# Altium schematic sheet MCU.SchDoc
size A; SheetNumber: 1; SheetTotal: 3
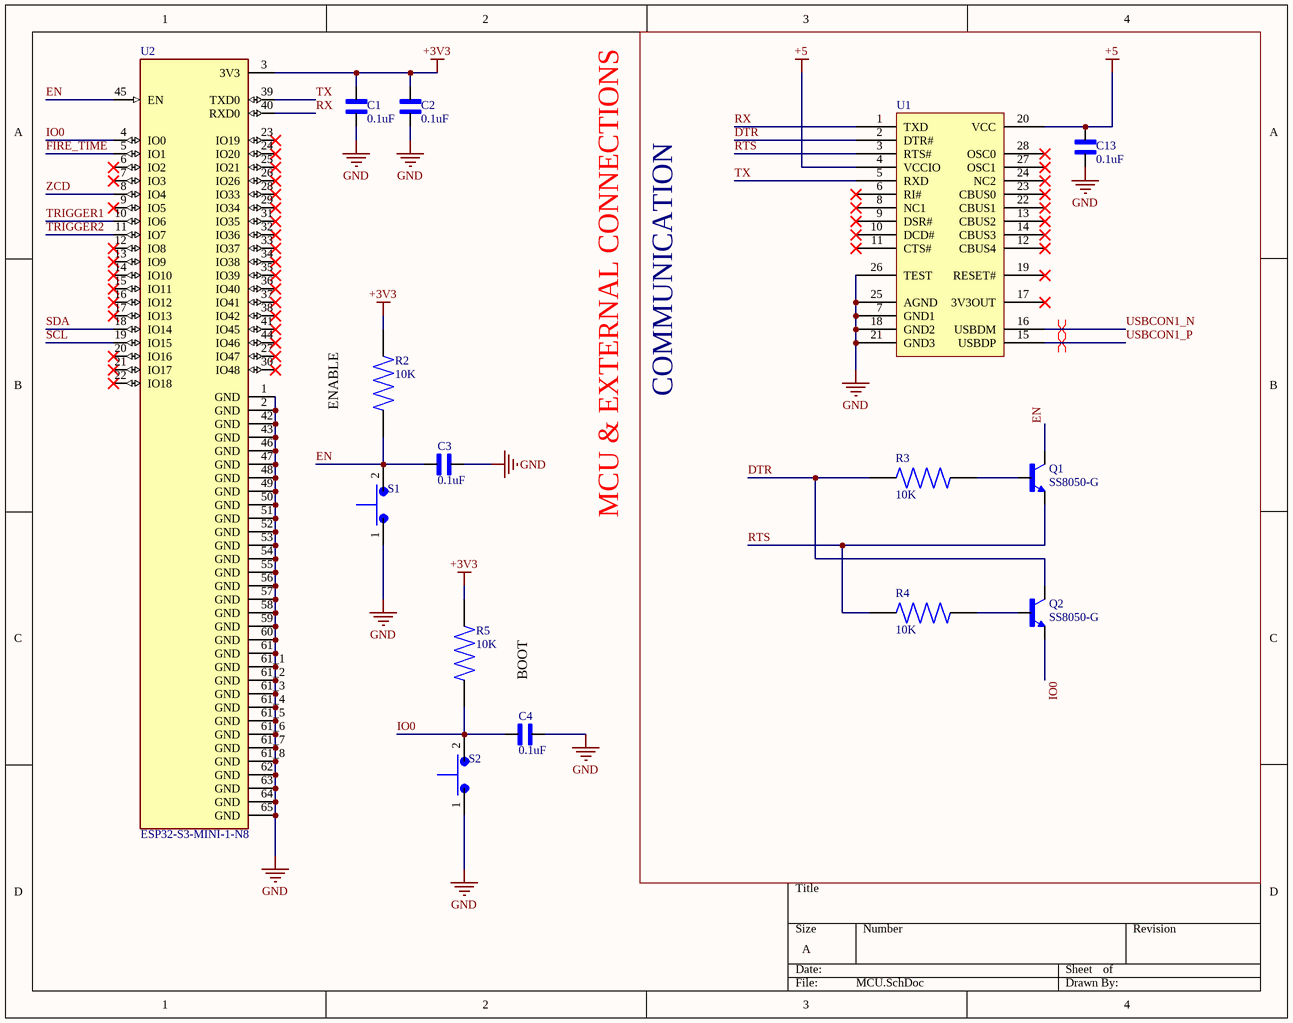
[diagram p0: MCU.SchDoc]

## Parts
C1  0.1uF  [CAPC1005X61N]
C2  0.1uF  [CAPC1005X61N]
C3  0.1uF  [CAPC1005X61N]
C4  0.1uF  [CAPC1005X61N]
C13  0.1uF  [CAPC1005X61N]
Q1  SS8050-G  [TRANS_SS8050-G]
Q2  SS8050-G  [TRANS_SS8050-G]
R2  10K  [RESC1005X35N]
R3  10K  [RESC1005X35N]
R4  10K  [RESC1005X35N]
R5  10K  [RESC1005X35N]
S1  TS10-63-26-BE-250-SMT-TR  [SW_TS10-63-26-BE-250-SMT-TR]  (value not drawn)
S2  TS10-63-26-BE-250-SMT-TR  [SW_TS10-63-26-BE-250-SMT-TR]  (value not drawn)
U1  FT232RL, Universal Asynchronous Receiver & Transmitter 3MBd, 28-Pin, SSOP  [SOP65P780X200-28N]  (value not drawn)
U2  ESP32-S3-MINI-1-N8  [XCVR_ESP32-S3-MINI-1-N8]

## Blocks framed on the sheet
COMMUNICATION: C13 Q1 Q2 R3 R4 U1

## Nets
+3V3: C1.2 C2.2 R2.2 R5.2 U2.3(3V3)
+5: C13.2 U1.4(VCCIO) U1.20(VCC)
GND: C1.1 C2.1 C3.2 C4.2 C13.1 S1.1 S2.1 U1.7(GND1) U1.18(GND2) U1.21(GND3) U1.25(AGND) U1.26(TEST) U2.1(GND) U2.2(GND) U2.42(GND) U2.43(GND) U2.46(GND) U2.47(GND) U2.48(GND) U2.49(GND) U2.50(GND) U2.51(GND) U2.52(GND) U2.53(GND) U2.54(GND) U2.55(GND) U2.56(GND) U2.57(GND) U2.58(GND) U2.59(GND) U2.60(GND) U2.61(GND) U2.61_1(GND) U2.61_2(GND) U2.61_3(GND) U2.61_4(GND) U2.61_5(GND) U2.61_6(GND) U2.61_7(GND) U2.61_8(GND) U2.62(GND) U2.63(GND) U2.64(GND) U2.65(GND)
DTR: Q2.3(C) R3.1 U1.2(DTR#)
EN: C3.1 Q1.3(C) R2.1 S1.2 U2.45(EN)
FIRE_TIME: U2.5(IO1)
IO0: C4.1 Q2.2(E) R5.1 S2.2 U2.4(IO0)
RTS: Q1.2(E) R4.1 U1.3(RTS#)
RX: U1.1(TXD) U2.40(RXD0)
SCL: U2.19(IO15)
SDA: U2.18(IO14)
TRIGGER1: U2.10(IO6)
TRIGGER2: U2.11(IO7)
TX: U1.5(RXD) U2.39(TXD0)
USBCON1_N: U1.16(USBDM)
USBCON1_P: U1.15(USBDP)
ZCD: U2.8(IO4)
NetQ1_1: Q1.1(B) R3.2
NetQ2_1: Q2.1(B) R4.2

Not connected (* = marked no-connect by the designer): U1 6(RI#)* 8(NC1)* 9(DSR#)* 10(DCD#)* 11(CTS#)* 12(CBUS4)* 13(CBUS2)* 14(CBUS3)* 17(3V3OUT)* 19(RESET#)* 22(CBUS1)* 23(CBUS0)* 24(NC2)* 27(OSC1)* 28(OSC0)*; U2 6(IO2)* 7(IO3)* 9(IO5)* 12(IO8)* 13(IO9)* 14(IO10)* 15(IO11)* 16(IO12)* 17(IO13)* 20(IO16)* 21(IO17)* 22(IO18)* 23(IO19)* 24(IO20)* 25(IO21)* 26(IO26)* 27(IO47)* 28(IO33)* 29(IO34)* 30(IO48)* 31(IO35)* 32(IO36)* 33(IO37)* 34(IO38)* 35(IO39)* 36(IO40)* 37(IO41)* 38(IO42)* 41(IO45)* 44(IO46)*

## Layout directives
differential pair: USBCON1_N, USBCON1_P

## Notes on the sheet
- (near R2) ENABLE
- MCU & EXTERNAL CONNECTIONS
- BOOT

## Library data of the parts
C1-C4 C13 = VJ0402D130GXCAP: CAP CER 13PF 200V C0G/NP0 0402; MF: Vishay Vitramon; SnapEDA_Link: https://www.snapeda.com/parts/VJ0402D130GXCAP/Vishay/view-part/?ref=snap; Package: 1005 Vishay Vitramon; Value: *; MP: VJ0402D130GXCAP; Check_prices: https://www.snapeda.com/parts/VJ0402D130GXCAP/Vishay/view-part/?ref=eda
Q1 Q2 = SS8050-G: Bipolar (BJT) Transistor NPN 25 V 1.5 A 100MHz 300 mW Surface Mount SOT-23-3; MP: SS8050G; MF: Comchip; Digi-Key_Part_Number: 641-1790-2-ND; Check_prices: https://www.snapeda.com/parts/SS8050G/Comchip/view-part/?ref=eda; Package: None; SnapEDA_Link: https://www.snapeda.com/parts/SS8050G/Comchip/view-part/?ref=snap; Value: *
R2-R5 = RT0402FRE075K1L: Res Thin Film 0402 10K Ohm 1% 0.063W(1/16W) Â±50ppm/C Molded SMD Paper T/R; MF: Yageo; SnapEDA_Link: https://www.snapeda.com/parts/RT0402FRE075K1L/Yageo/view-part/?ref=snap; Package: 1005 Yageo; Value: *; MP: RT0402FRE075K1L; Check_prices: https://www.snapeda.com/parts/RT0402FRE075K1L/Yageo/view-part/?ref=eda
S1 S2 = TS10-63-26-BE-250-SMT-TR: 6.1 x 3.8 mm, 2.6 mm Actuator Height, 250 gf, Surface Mount, SPST, Tactile Switch; MF: Same Sky; SnapEDA_Link: https://www.snapeda.com/parts/TS10-63-26-BE-250-SMT-TR/Same+Sky/view-part/?ref=snap; Package: None; Value: *; MP: TS10-63-26-BE-250-SMT-TR; Check_prices: https://www.snapeda.com/parts/TS10-63-26-BE-250-SMT-TR/Same+Sky/view-part/?ref=eda
U1 = FT232RL USB to UART, Universal Asynchronous Receiver & Transmitter 3MBd, 28-Pin, SSOP: Manufacturer: FTDI Chip; Creator: R Kanjee; Date Created: 03 March 2015; Manufacturer Part No.: FT232RL; RS Stock No.: 406-580; Pin Count: 28
U2 = ESP32-S3-MINI-1-N8: MF: {'manufacturer': u'Espressif Systems'}; Package: None; Price: None; Value: *; MP: ESP32-S3-MINI-1-N8; Availability: Unavailable